# Altium schematic sheet LoRa.SchDoc
size A4; SheetNumber: 3; SheetTotal: 4
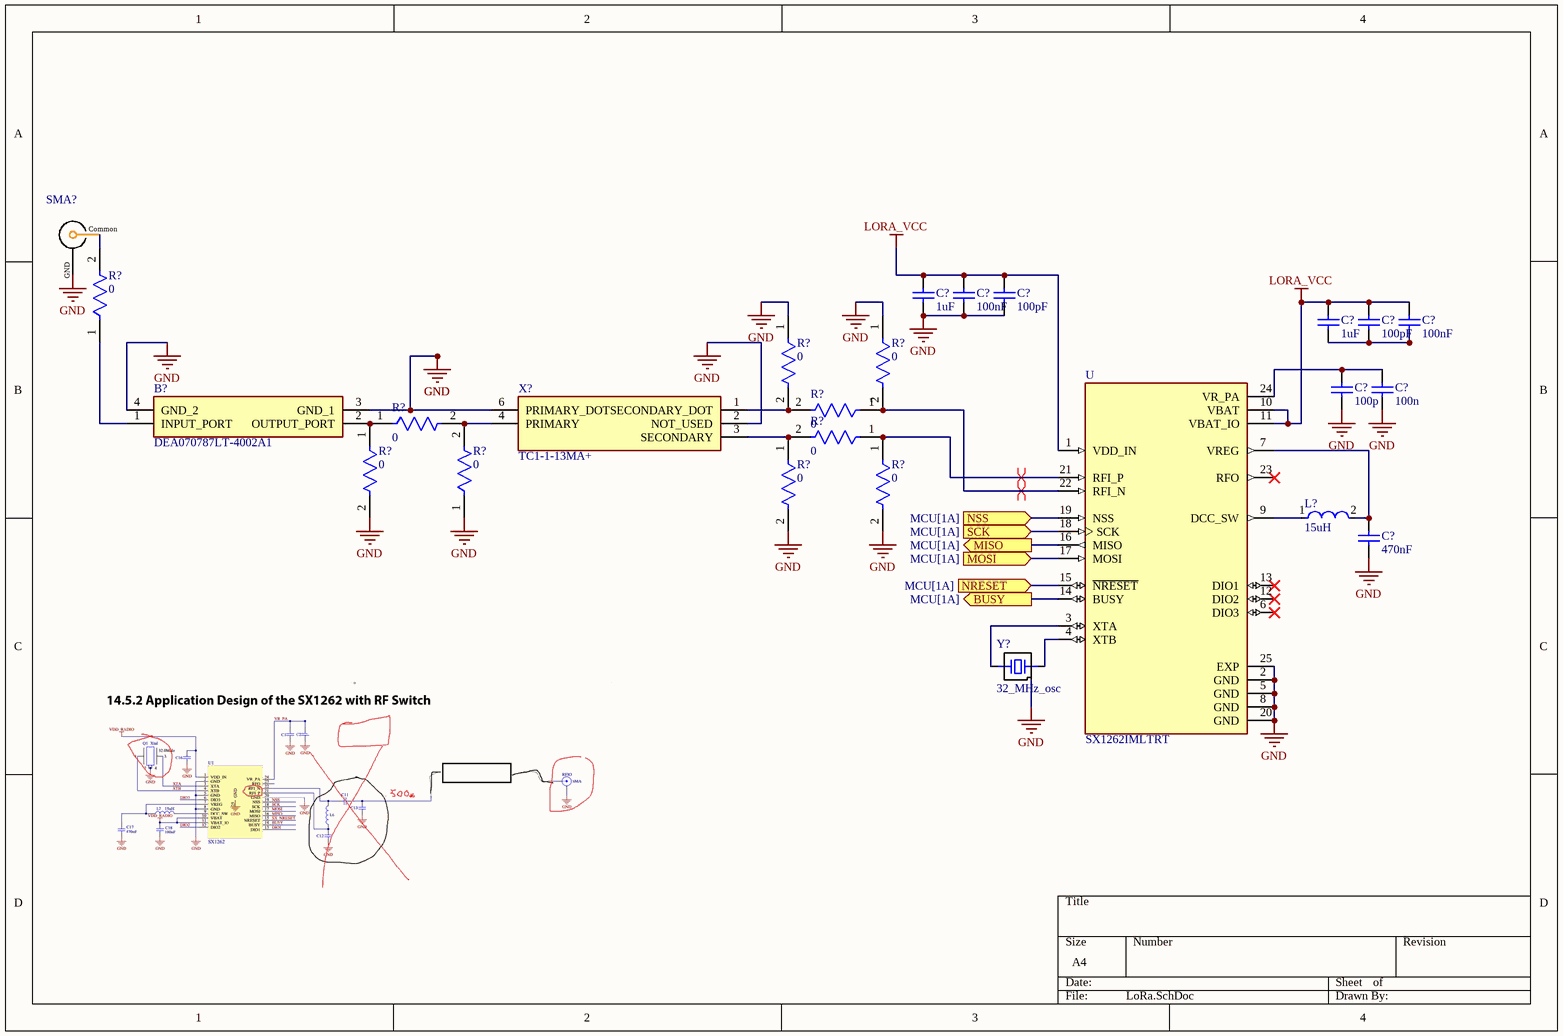
[diagram p0: LoRa.SchDoc]

## Parts
(Parts that share a designator on the sheet are numbered #1, #2 ... from top to bottom, then left to right.)
B?  DEA070787LT-4002A1  [DEA070787LT4002A1]
C?#1  1uF  [CAP_0402]
C?#2  100nF  [CAP_0402]
C?#3  100pF  [CAP_0402]
C?#4  1uF  [CAP_0402]
C?#5  100pF  [CAP_0402]
C?#6  100nF  [CAP_0402]
C?#7  100p  [CAP_0402]
C?#8  100n  [CAP_0402]
C?#9  470nF  [CAP_0402]
L?  15uH  [L_0402]
R?#1  0  [Res_0402]
R?#2  0  [Res_0402]
R?#3  0  [Res_0402]
R?#4  0  [Res_0402]
R?#5  0  [Res_0402]
R?#6  0  [Res_0402]
R?#7  0  [Res_0402]
R?#8  0  [Res_0402]
R?#9  0  [Res_0402]
R?#10  0  [Res_0402]
SMA?  SMA  [SMA_BWSMA-KE11]  (value not drawn)
U  SX1262IMLTRT  [QFN50P400X400X100-25N]
X?  TC1-1-13MA+  [TC1113MA]
Y?  32_MHz_osc  [SMD3225-4P]

## Ports
BUSY (out, see MCU[1A]), MISO (out, see MCU[1A]), MOSI (in, see MCU[1A]), NRESET (in, see MCU[1A]), NSS (in, see MCU[1A]), SCK (in, see MCU[1A])

## Nets
GND: B?.3(GND_1) B?.4(GND_2) C?#1.1 C?#2.1 C?#3.1 C?#7.1 C?#8.1 C?#9.1 R?#1.1 R?#2.1 R?#6.2 R?#7.2 R?#9.2 R?#10.1 SMA?.GND U.2(GND) U.5(GND) U.8(GND) U.20(GND) U.25(EXP) X?.2(NOT_USED) X?.6(PRIMARY_DOT) Y?.GND
LORA_VCC: C?#1.2 C?#2.2 C?#3.2 C?#4.2 C?#5.2 C?#6.2 U.1(VDD_IN) U.10(VBAT) U.11(VBAT_IO)
BUSY: U.14(BUSY) ; port BUSY
MISO: U.16(MISO) ; port MISO
MOSI: U.17(MOSI) ; port MOSI
NRESET: U.15(~{NRESET}) ; port NRESET
NSS: U.19(NSS) ; port NSS
SCK: U.18(SCK) ; port SCK
NetB?_1: B?.1(INPUT_PORT) R?#3.1
NetB?_2: B?.2(OUTPUT_PORT) R?#5.1 R?#6.1
NetC?#4_1: C?#4.1 C?#5.1 C?#6.1
NetC?#7_2: C?#7.2 C?#8.2 U.24(VR_PA)
NetC?#9_2: C?#9.2 L?.2 U.7(VREG)
NetL?_1: L?.1 U.9(DCC_SW)
NetR?#1_2: R?#1.2 R?#4.2 X?.1(SECONDARY_DOT)
NetR?#2_2: R?#2.2 R?#4.1 U.22(RFI_N)
NetR?#3_2: R?#3.2 SMA?.Common
NetR?#5_2: R?#5.2 R?#10.2 X?.4(PRIMARY)
NetR?#7_1: R?#7.1 R?#8.2 X?.3(SECONDARY)
NetR?#8_1: R?#8.1 R?#9.1 U.21(RFI_P)
NetU_3: U.3(XTA) Y?.IN
NetU_4: U.4(XTB) Y?.OUT

Not connected (* = marked no-connect by the designer): U 6(DIO3)* 12(DIO2)* 13(DIO1)* 23(RFO)*

## Layout directives
differential pair: NetR?#2_2, NetR?#8_1

## Library data of the parts
B? = DEA070787LT-4002A1: Filters, Pass Band=777 to 787MHz, Zc=50se; Manufacturer_Name: TDK; Geometry.Height: 0.3mm; Mouser Part Number: 810-DEA070787LT42A1; Mouser Price/Stock: https://www.mouser.co.uk/ProductDetail/TDK/DEA070787LT-4002A1?qs=t7xnP681wgWsMS%252BzXDdMJg%3D%3D; Manufacturer_Part_Number: DEA070787LT-4002A1; Datasheet Link: https://product.tdk.com/system/files/dam/doc/product/rf/rf/filter/catalog/rf_lpf_dea070787lt-4002a1_en.pdf
C?#1-C?#9 = CAP_0402: Part Number: C0402T103K4RACTU; Manufacturer: Kemet
  C?#1 C?#4: Value: 1uF
  C?#2 C?#6: Value: 100nF
  C?#3 C?#5: Value: 100pF
  C?#7: Value: 100p
  C?#8: Value: 100n
  C?#9: Value: 470nF
L? = L_0402: Wire Wound Ferrite type RF Inductor 140nH ±5% 650mA 0.216Ω 0402 (1005); Value: 15uH
R?#1-R?#10 = R_0402: RES SMD 1.2K OHM 1% 1/10W 0402; Resistance: 12400R; Tolerance: 1%; Lead Free: Lead Free; Width: 500um; Length: 1mm; Height: 320um; Case/Package: 0402; Value: 0
SMA? = BWSMA-KE11: SMD_or_DIP: SMD; Vertical_or_Horizontal: Horizontal; Value: SMD_Horizontal; Part Number: BWSMA-KE11; JLCPCB Part #: C5250058; Connector_Type: SMA; Max_Frequency: ?; ComponentLink1URL: https://jlcpcb.com/api/file/downloadByFileSystemAccessId/8590456158969360384; ComponentLink1Description: Datasheet; JLCRotOffset: -90
U = SX1262IMLTRT: IC RF TxRx Only General ISM < 1GHz LoRaWAN 150MHz ~ 960MHz 24-VFQFN Exposed Pad; MF: Semtech Corporation; Value: *; SnapEDA_Link: https://www.snapeda.com/parts/SX1262IMLTRT/Semtech%20Corporation/view-part/2781045/?ref=snap; Availability: Unavailable; Package: VFQFN-24 Semtech; Price: None; MP: SX1262IMLTRT
X? = TC1-1-13MA+: RF TRANSFORMER, 4.5 - 3000 MHZ,; Manufacturer_Name: Mini-Circuits; Geometry.Height: 4.06mm; Mouser Part Number: 139-TC1-1-13MA; Mouser Price/Stock: https://www.mouser.co.uk/ProductDetail/Mini-Circuits/TC1-1-13MA%2b?qs=xZ%2FP%252Ba9zWqaQyucfPXsKqA%3D%3D; Manufacturer_Part_Number: TC1-1-13MA+; Datasheet Link: TC1-1-13MA+
Y? = X322532MOB4SI: frequency_(MHz): 32; Part Number: X322532MOB4SI; JLCPCB Part #: C9009; Value: 32_MHz_osc; ComponentLink1URL: https://jlcpcb.com/api/file/downloadByFileSystemAccessId/8588879124404715520; ComponentLink1Description: Datasheet